# Altium project GTV4.0_Board.PrjPcb (part 7 of 11)

## Sheet Valve_Section.SchDoc
size 420 x 297 mm; DocumentNumber: 12; SheetNumber: 12; SheetTotal: 17
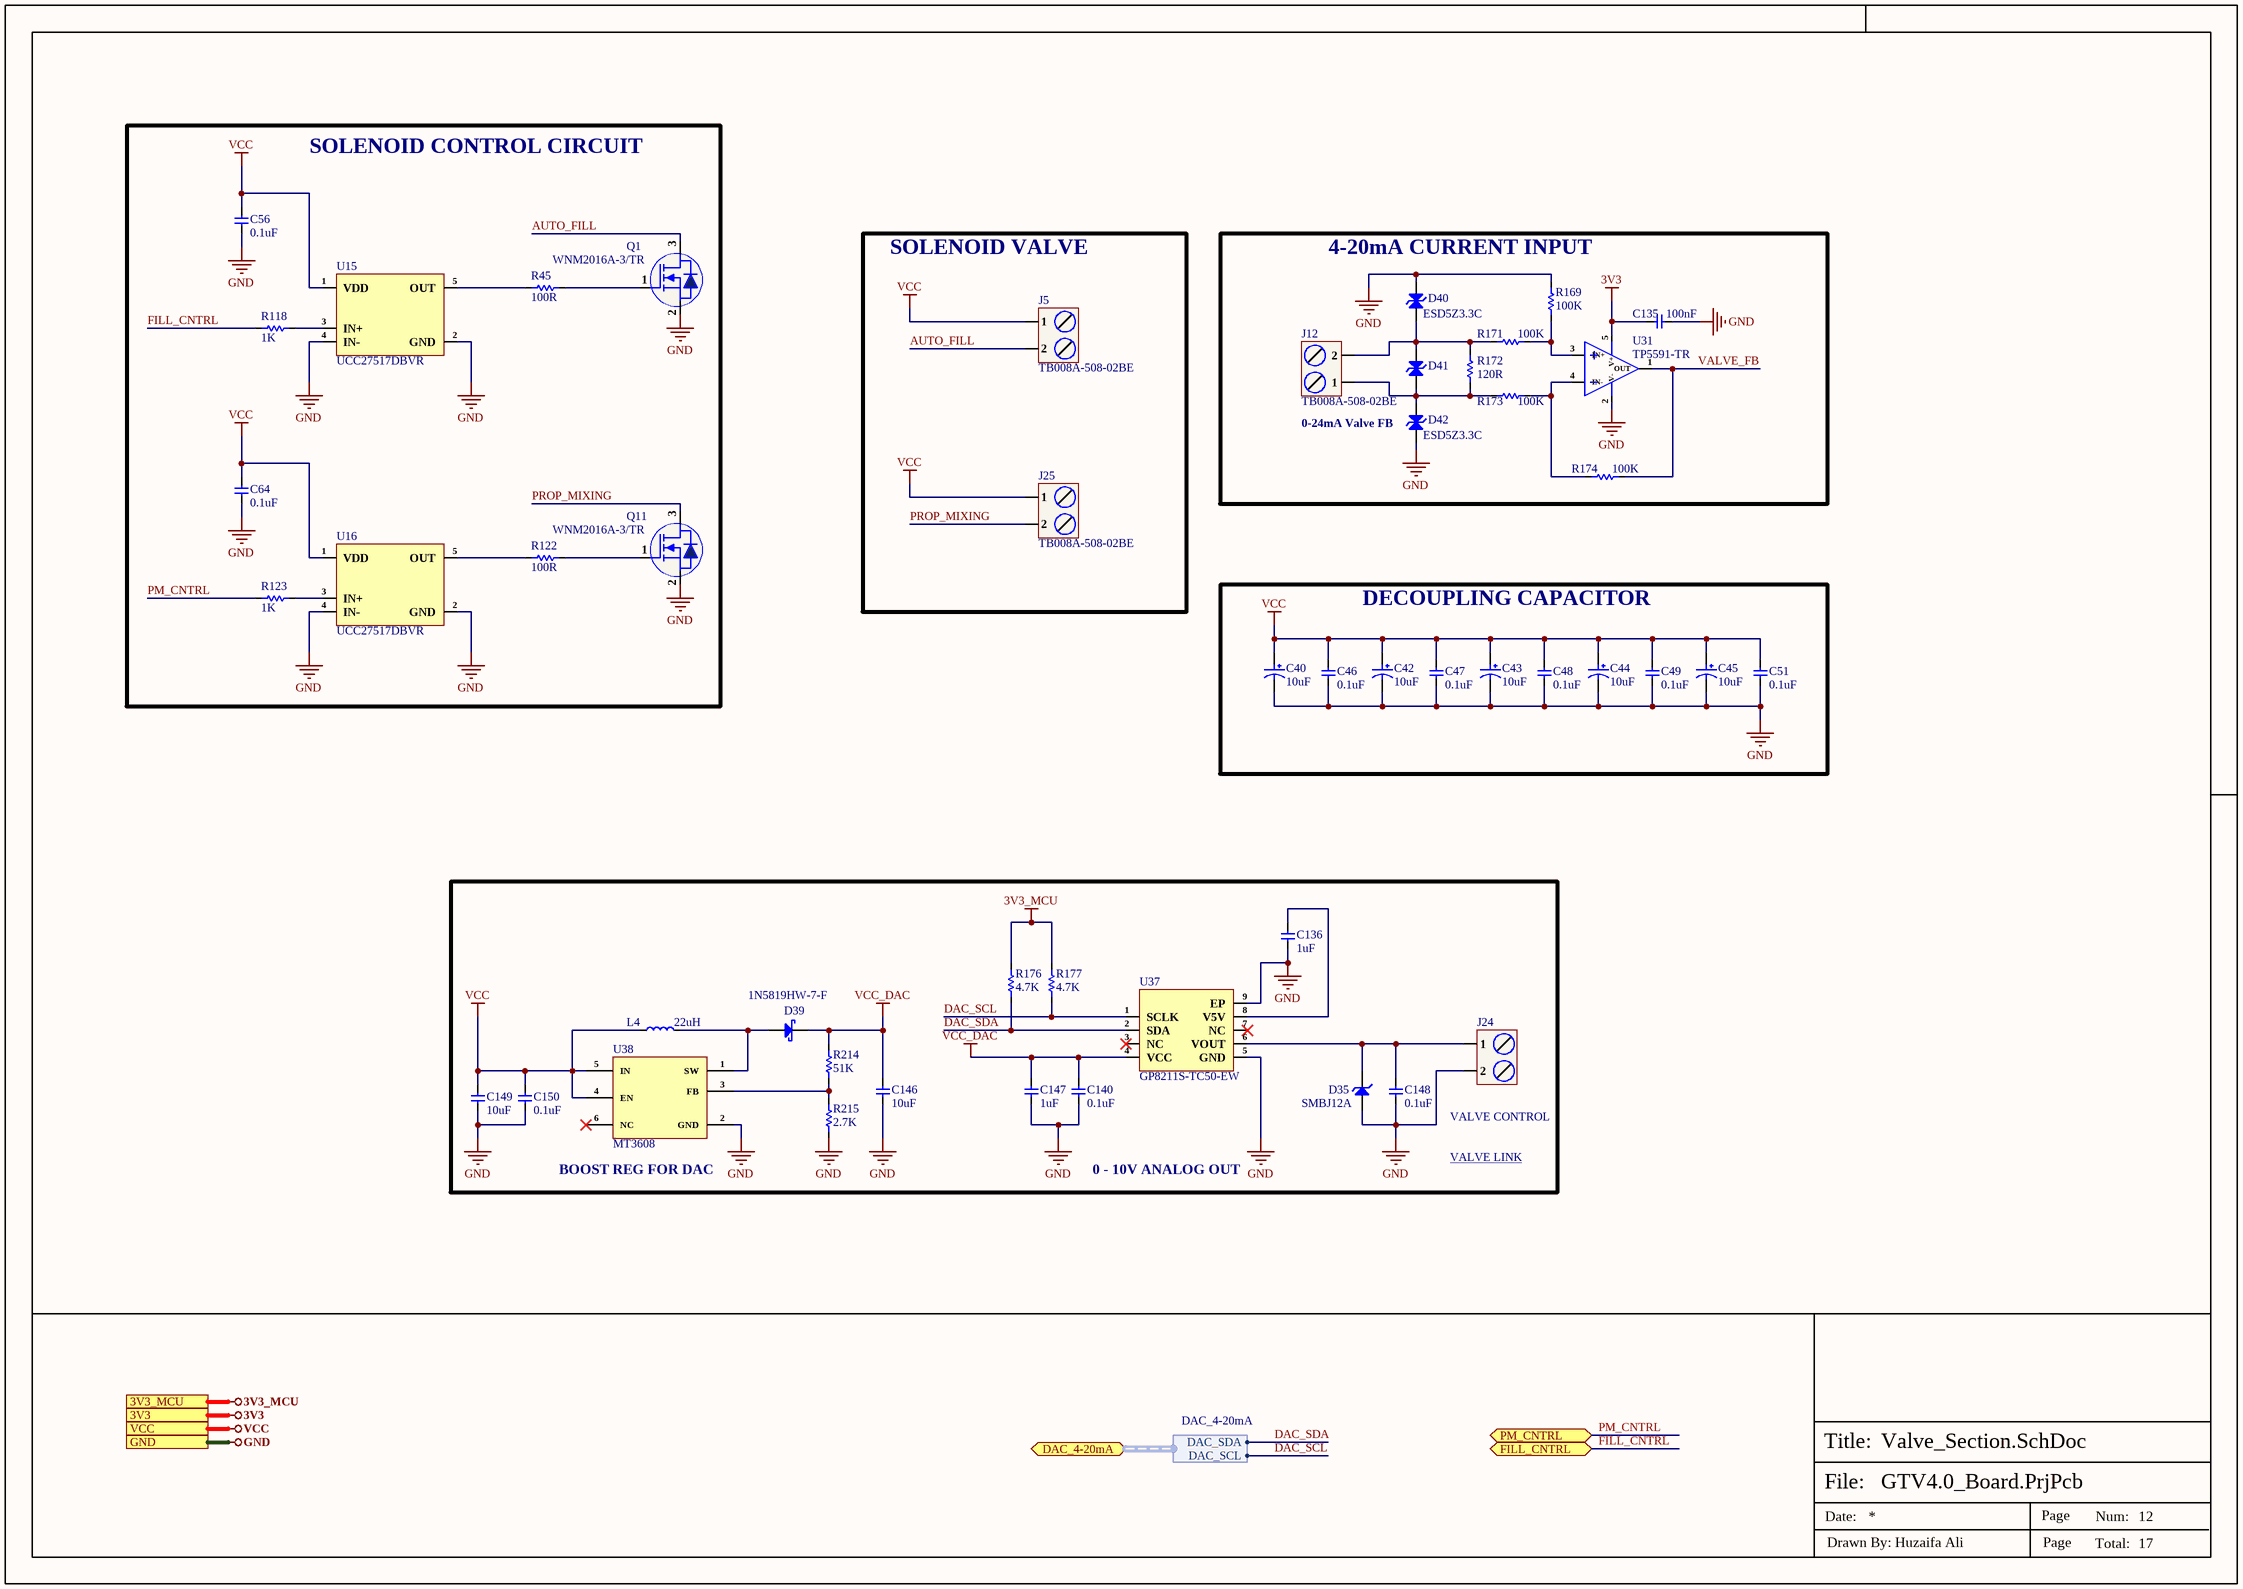
[diagram p12: Valve_Section.SchDoc]

### Parts
C40  10uF  [RVT1E100M0405_]
C42  10uF  [RVT1E100M0405_]
C43  10uF  [RVT1E100M0405_]
C44  10uF  [RVT1E100M0405_]
C45  10uF  [RVT1E100M0405_]
C46  0.1uF  [Cap-0603]
C47  0.1uF  [Cap-0603]
C48  0.1uF  [Cap-0603]
C49  0.1uF  [Cap-0603]
C51  0.1uF  [Cap-0603]
C56  0.1uF  [Cap-0402]
C64  0.1uF  [Cap-0402]
C135  100nF  [Cap-0603]
C136  1uF  [Cap-0402]
C140  0.1uF  [Cap-0402]
C146  10uF  [Cap-0805]
C147  1uF  [Cap-0402]
C148  0.1uF  [Cap-0402]
C149  10uF  [Cap-0805]
C150  0.1uF  [Cap-0402]
D35  SMBJ12A  [SMB_]
D39  1N5819HW-7-F  [SOD-123]
D40  ESD5Z3.3C  [SOD-523 (Bi-Directional)]
D41  ESD5Z3.3C  [SOD-523 (Bi-Directional)]  (value not drawn)
D42  ESD5Z3.3C  [SOD-523 (Bi-Directional)]
J5  TB008A-508-02BE  [TB008A-508-02BE]
J12  TB008A-508-02BE  [TB008A-508-02BE]
J24  TB008A-508-02BE  [TB008A-508-02BE]  (value not drawn)
J25  TB008A-508-02BE  [TB008A-508-02BE]
L4  22uH  [YNR4018-220M]
Q1  WNM2016A-3/TR  [sot-23]
Q11  WNM2016A-3/TR  [sot-23]
R45  100R  [RES-0603]
R118  1K  [Res-0402]
R122  100R  [RES-0603]
R123  1K  [Res-0402]
R169  100K  [Res-0603]
R171  100K  [Res-0603]
R172  120R  [Res-0603]
R173  100K  [Res-0603]
R174  100K  [Res-0603]
R176  4.7K  [Res-0402]
R177  4.7K  [Res-0402]
R214  51K  [Res-0402]
R215  2.7K  [Res-0402]
U15  UCC27517DBVR  [SOT-23-5]
U16  UCC27517DBVR  [SOT-23-5]
U31  TP5591-TR  [SOT-23-5]
U37  GP8211S-TC50-EW  [ESOP-8]
U38  MT3608  [SOT-23-6]

### Blocks framed on the sheet
SOLENOID CONTROL CIRCUIT: C56 C64 Q1 Q11 R45 R118 R122 R123 U15 U16
SOLENOID VALVE: J5 J25
4-20mA CURRENT INPUT: C135 D40-D42 J12 R169 R171-R174 U31
DECOUPLING CAPACITOR: C40 C42-C49 C51

### Ports
3V3, 3V3_MCU, DAC_4-20mA (bidir, harness DAC_4-20mA), FILL_CNTRL (bidir), GND, PM_CNTRL (bidir), VCC

### Harnesses
DAC_4-20mA: DAC_SDA, DAC_SCL

### Nets
3V3: C135.2 U31.5(V+) ; port 3V3
3V3_MCU: R176.2 R177.2 ; port 3V3_MCU
GND: C40.2 C42.2 C43.2 C44.2 C45.2 C46.1 C47.1 C48.1 C49.1 C51.1 C56.1 C64.1 C135.1 C136.1 C140.1 C146.1 C147.1 C148.1 C149.1 C150.1 D35.1(A) D40.2(A) D42.1(A) J24.2 Q1.2(S) Q11.2(S) R169.2 R215.1 U15.2(GND) U15.4(IN-) U16.2(GND) U16.4(IN-) U31.2(V-) U37.5(GND) U37.9(EP) U38.2(GND) ; port GND
VCC: C40.1 C42.1 C43.1 C44.1 C45.1 C46.2 C47.2 C48.2 C49.2 C51.2 C56.2 C64.2 C149.2 C150.2 J5.1 J25.1 L4.1 U15.1(VDD) U16.1(VDD) U38.4(EN) U38.5(IN) ; port VCC
VCC_DAC: C140.2 C146.2 C147.2 D39.2(K) R214.2 U37.4(VCC)
AUTO_FILL: J5.2 Q1.3(D)
DAC_SCL: R177.1 U37.1(SCLK) ; port DAC_4-20mA.DAC_SCL
DAC_SDA: R176.1 U37.2(SDA) ; port DAC_4-20mA.DAC_SDA
FILL_CNTRL: R118.1 ; port FILL_CNTRL
PM_CNTRL: R123.1 ; port PM_CNTRL
PROP_MIXING: J25.2 Q11.3(D)
VALVE_FB: R174.2 U31.1(OUT)
NetC136_2: C136.2 U37.8(V5V)
NetC148_2: C148.2 D35.2(K) J24.1 U37.6(VOUT)
NetD39_1: D39.1(A) L4.2 U38.1(SW)
NetD40_1: D40.1(A) D41.2(A) J12.2 R171.1 R172.2
NetD41_1: D41.1(A) D42.2(A) J12.1 R172.1 R173.1
NetQ1_1: Q1.1(G) R45.2
NetQ11_1: Q11.1(G) R122.2
NetR45_1: R45.1 U15.5(OUT)
NetR118_2: R118.2 U15.3(IN+)
NetR122_1: R122.1 U16.5(OUT)
NetR123_2: R123.2 U16.3(IN+)
NetR169_1: R169.1 R171.2 U31.3(IN+)
NetR173_2: R173.2 R174.1 U31.4(IN-)
NetR214_1: R214.1 R215.2 U38.3(FB)

Not connected (* = marked no-connect by the designer): U37 3(NC)* 7(NC)*; U38 6(NC)*

### Notes on the sheet
- 0-24mA Valve FB
- VALVE CONTROL
- (near U38) BOOST REG FOR DAC
- 0 - 10V ANALOG OUT
- VALVE LINK <https://vi.aliexpress.com/i/2251832634251781.html?gatewayAdapt=glo2vnm4itemAdapt>
- File:
- Title:
- Date:
- Page
- Num:
- Total:
- Drawn By: Huzaifa Ali

### Library data of the parts
C40 C42-C45 = RVT1E100M0405: as C76 on sheet WIFI_Display_Sheet; Operating Temperature: -45℃~+105℃; Rated Voltage: 25V; Capacitance: 10uF; Manufacturer Part Number: RVT1E100M0405; ComponentLink1Description: LCSC; ComponentLink1URL: https://www.lcsc.com/product-detail/Aluminum-Electrolytic-Capacitors-SMD_10uF-25V-20_C72484.html; LCSC Part Number: C970655
C46-C49 C51 = CC0603ZRY5V9BB104: as C69 on sheet WIFI_Display_Sheet; Supplier 1: Digi-Key; Manufacturer Part Number: CC0603ZRY5V9BB104; Stock 1: 15000880; Pricing 1: 1=0.1, 10=0.075, 100=0.0334, 500=0.02386, 1000=0.01874 (USD); Mount: Surface Mount; Case/Package: 0603; Number of Pins: 2; Case Code (Metric): 1608; Case Code (Imperial): 0603; Min Operating Temperature: -30°C; Max Operating Temperature: 85°C; Dielectric: Y5V; Voltage Rating: 50V; Package Quantity: 1; Packaging: Tape and Reel; Voltage Rating (DC): 50V; Termination: SMD/SMT; Composition: Ceramic; Voltage: 50V; Length: 1.6mm; Height: 0.8mm; Width: 0.031inch; Thickness: 0.035inch; Depth: 0.8mm; Radiation Hardening: No; REACH SVHC: No SVHC; Lead Free: Lead Free; Halogen Free: Halogen Free; ComponentLink1URL: http://www.yageo.com/documents/recent/UPY-GPHC_Y5V_6.3V-to-50V_8.pdf?src-supplier=Digi-Key; ComponentLink1Description: http://www.yageo.com/documents/recent/UPY-GPHC_Y5V_6.3V-to-50V_8.pdf?src-supplier=Digi-Key; ComponentLink2URL: http://www.yageo.com/documents/recent/UPY-GPHC_Y5V_6.3V-to-50V_5.pdf?src-supplier=Avnet+Europe; ComponentLink2Description: http://www.yageo.com/documents/recent/UPY-GPHC_Y5V_6.3V-to-50V_5.pdf?src-supplier=Avnet+Europe; ComponentLink3URL: https://www.verical.com/server-webapp/html/getDatasheet?partID=403611&src-supplier=Verical; ComponentLink3Description: https://www.verical.com/server-webapp/html/getDatasheet?partID=403611&src-supplier=Verical; ComponentLink4URL: http://www.mouser.com/ds/2/447/Yageo_UPY-GP_NP0_16V-to-50V_9-358835.pdf?src-supplier=Mouser; ComponentLink4Description: http://www.mouser.com/ds/2/447/Yageo_UPY-GP_NP0_16V-to-50V_9-358835.pdf?src-supplier=Mouser; ComponentLink5URL: http://www.farnell.com/datasheets/1132289.pdf?src-supplier=Element14; ComponentLink5Description: http://www.farnell.com/datasheets/1132289.pdf?src-supplier=Element14; Supplier Part Number 1: 311-1343-1-ND; LCSC Part Number: C106221
C56 C64 = CC0402JRX7R7BB104: CAP CER 0.1UF 16V X7R 0402; Manufacturer: Yageo; Material: 4241ConductorMaterial; Value: 100nF; Tolerance: 5%; Item Type: Capacitor; Supplier: Digikey; Supplier Part Number: 311-1676-1-ND; Manufacturer Part Number: CC0402JRX7R7BB104; RoHS: Yes; Category: Ceramic Capacitors; Stock: 1659111; Pricing: 1=0.1, 10=0.046, 50=0.0262, 100=0.0203, 500=0.01528, 1000=0.012, 2500=0.01091, 5000=0.01004 (USD); Mounting Technology: Surface Mount; Case/Package: 0402; Case Code (Metric): 1005; Case Code (Imperial): 0402; Min Operating Temperature: -55°C; Max Operating Temperature: 125°C; Dielectric: X7R; Packaging: Tape and Reel; Package Quantity: 10000; Voltage Rating (DC): 16V; Voltage Rating: 16V; Series: CC; Construction: Flat; Length: 0.039inch; Width: 0.02inch; Height: 0.5mm; Thickness: 0.022inch; Lead Free: Lead Free; Halogen Free: Halogen Free; RoHS Compliant: Yes; ComponentLink1URL: https://datasheet.ciiva.com/13210/upy-gphc-x7r-6-3v-to-50v-8-12304-13210152.pdf?src-supplier=Mouser; ComponentLink1Description: https://datasheet.ciiva.com/13210/upy-gphc-x7r-6-3v-to-50v-8-12304-13210152.pdf?src-supplier=Mouser; LCSC Part Number: C541464
C135 = CC0603KRX5R9BB104: CAP CER 0.1UF 50V X5R 0603; Manufacturer: Yageo; Tolerance: 10%; Item Type: Capacitor; Supplier 1: Digi-Key; Manufacturer Part Number: CC0603KRX5R9BB104; RoHS: Yes; Category: Ceramic Capacitors; Stock 1: 152253; Pricing 1: 1=0.10000, 10=0.05200, 50=0.02820, 100=0.02310, 500=0.01648, 1000=0.01294 (USD); Mount: Surface Mount; Case/Package: 0603; Case Code (Imperial): 0603; Case Code (Metric): 1608; Weight: 7.1E-05oz; Min Operating Temperature: -55°C; Max Operating Temperature: 85°C; Capacitance: 100nF; Packaging: Tape and Reel; Voltage Rating: 50V; Dielectric: X5R; Termination: SMD/SMT; Voltage Rating (DC): 50V; Package Quantity: 4000; Length: 0.063inch; Width: 0.031inch; Thickness: 0.035inch; Lead Free: Lead Free; Halogen Free: Halogen Free; ComponentLink1URL: http://www.mouser.com/ds/2/447/Yageo_UPY-GP_NP0_16V-to-50V_9-358835.pdf?src-supplier=Mouser; ComponentLink1Description: http://www.mouser.com/ds/2/447/Yageo_UPY-GP_NP0_16V-to-50V_9-358835.pdf?src-supplier=Mouser; ComponentLink2URL: https://www.yageo.com/upload/media/product/productsearch/datasheet/mlcc/UPY-GPHC_X5R_4V-to-50V_26.pdf?src-supplier=Digi-Key; ComponentLink2Description: https://www.yageo.com/upload/media/product/productsearch/datasheet/mlcc/UPY-GPHC_X5R_4V-to-50V_26.pdf?src-supplier=Digi-Key; ComponentLink3URL: http://www.yageo.com/exep/pages/download/literatures/ProductSelectionGuide%202014_Final_2.pdf?src-supplier=Digi-Key; ComponentLink3Description: http://www.yageo.com/exep/pages/download/literatures/ProductSelectionGuide%202014_Final_2.pdf?src-supplier=Digi-Key; Supplier Part Number 1: 311-4046-1-ND; LCSC Part Number: C110022
C136 = CC0402KRX5R7BB105: as C7 on sheet Controller_Section; Supplier 1: Digi-Key; Manufacturer Part Number: CC0402KRX5R7BB105; Stock 1: 1405667; Pricing 1: 1=0.36, 10=0.252, 100=0.1512, 500=0.1134, 1000=0.09576, 2500=0.09072, 5000=0.08568 (USD); Mount: Surface Mount; Case/Package: 0402; Weight: 2.3E-05oz; Case Code (Imperial): 0402; Case Code (Metric): 1005; Min Operating Temperature: -55°C; Max Operating Temperature: 85°C; Capacitance: 1uF; Dielectric: X5R; Packaging: Tape and Reel; Voltage Rating (DC): 16V; Voltage Rating: 16V; Termination: SMD/SMT; Composition: Ceramic; Length: 1mm; Height: 0.5mm; Width: 0.02inch; Thickness: 0.022inch; Depth: 0.5mm; Radiation Hardening: No; Lead Free: Lead Free; Halogen Free: Halogen Free; ComponentLink1URL: http://www.yageo.com/documents/recent/UPY-GPHC_X5R_4V-to-50V_12.pdf?src-supplier=Avnet+Europe; ComponentLink1Description: http://www.yageo.com/documents/recent/UPY-GPHC_X5R_4V-to-50V_12.pdf?src-supplier=Avnet+Europe; Supplier Part Number 1: 311-1691-6-ND; LCSC Part Number: C325464
C140 C148 C150 = CC0402KRX7R8BB104: CAP CER 0.1UF 25V X7R 0402; Manufacturer: Yageo; Tolerance: 10%; Capacitance: 100nF; Dissipation Factor: 3.5%; Supplier 1: Digi-Key; Manufacturer Part Number: CC0402KRX7R8BB104; RoHS: Yes; Category: Ceramic Capacitors; Stock 1: 1841009; Pricing 1: 1=0.10000, 10=0.03100, 50=0.01700, 100=0.01390, 500=0.00990, 1000=0.00777, 2500=0.00707, 5000=0.00650 (USD); Mount: Surface Mount; Case/Package: 0402; Case Code (Imperial): 0402; Case Code (Metric): 1005; Min Operating Temperature: -55°C; Max Operating Temperature: 125°C; Dielectric: X7R; Voltage Rating: 25V; Voltage Rating (DC): 25V; Packaging: Tape and Reel; Termination: SMD/SMT; Resistor Type: Ceramic; Length: 1mm; Width: 0.02inch; Height: 0.5mm; Thickness: 0.022inch; Depth: 0.5mm; Radiation Hardening: No; Lead Free: Lead Free; Halogen Free: Halogen Free; ComponentLink1URL: https://datasheet.ciiva.com/11464/upy-gphc-x7r-6-3v-to-50v-8-11464889.pdf?src-supplier=Avnet; ComponentLink1Description: https://datasheet.ciiva.com/11464/upy-gphc-x7r-6-3v-to-50v-8-11464889.pdf?src-supplier=Avnet; ComponentLink2URL: https://datasheet.ciiva.com/13210/upy-gphc-x7r-6-3v-to-50v-8-12304-13210908.pdf?src-supplier=Mouser; ComponentLink2Description: https://datasheet.ciiva.com/13210/upy-gphc-x7r-6-3v-to-50v-8-12304-13210908.pdf?src-supplier=Mouser; ComponentLink3URL: https://datasheet.ciiva.com/17437/upy-gphc-x7r-6-3v-to-50v-8-17437357.pdf?src-supplier=Avnet+Europe; ComponentLink3Description: https://datasheet.ciiva.com/17437/upy-gphc-x7r-6-3v-to-50v-8-17437357.pdf?src-supplier=Avnet+Europe; Supplier Part Number 1: 311-2077-1-ND; LCSC Part Number: C105883
C146 = EMK212BB7106MG-T: CAP CER 10UF 16V X7R 0805; Manufacturer: Taiyo Yuden; Tolerance: 20%; Item Type: Capacitor; Supplier 1: Digi-Key; Manufacturer Part Number: EMK212BB7106MG-T; RoHS: Yes; Category: Ceramic Capacitors; Stock 1: 896107; Pricing 1: 1=0.40000, 10=0.28000, 50=0.19620, 100=0.16820, 500=0.12612, 1000=0.10650 (USD); Mount: Surface Mount; Case/Package: 0805; Case Code (Metric): 2012; Case Code (Imperial): 0805; Min Operating Temperature: -55°C; Max Operating Temperature: 125°C; Package Quantity: 3000; Packaging: Tape and Reel; Capacitance: 10uF; Voltage Rating: 16V; Voltage Rating (DC): 16V; Dielectric: X7R; Termination: SMD/SMT; Resistor Type: Ceramic; Length: 2mm; Width: 0.049inch; Height: 1.25mm; Thickness: 0.053inch; Ratings: AEC-Q200; Halogen Free: Halogen Free; RoHS Compliant: Yes; ComponentLink1URL: https://datasheet.ciiva.com/24393/472emk212bb7106mg-t-24393497.pdf?src-supplier=Onlinecomponents.com; ComponentLink1Description: https://datasheet.ciiva.com/24393/472emk212bb7106mg-t-24393497.pdf?src-supplier=Onlinecomponents.com; ComponentLink2URL: https://datasheet.ciiva.com/30229/379emk212bb7106mg-t-30229719.pdf?src-supplier=Onlinecomponents.com; ComponentLink2Description: https://datasheet.ciiva.com/30229/379emk212bb7106mg-t-30229719.pdf?src-supplier=Onlinecomponents.com; ComponentLink3URL: https://datasheet.ciiva.com/18697/mlcc-all-e-18697736.pdf?src-supplier=Digi-Key; ComponentLink3Description: https://datasheet.ciiva.com/18697/mlcc-all-e-18697736.pdf?src-supplier=Digi-Key; ComponentLink4URL: https://datasheet.ciiva.com/18697/mlcc-all-e-18697735.pdf?src-supplier=Digi-Key; ComponentLink4Description: https://datasheet.ciiva.com/18697/mlcc-all-e-18697735.pdf?src-supplier=Digi-Key; ComponentLink5URL: https://datasheet.ciiva.com/18697/mlcc-all-e-18697737.pdf?src-supplier=Digi-Key; ComponentLink5Description: https://datasheet.ciiva.com/18697/mlcc-all-e-18697737.pdf?src-supplier=Digi-Key; ComponentLink6URL: https://datasheet.ciiva.com/15376/mlcc01-e-15376088.pdf?src-supplier=Mouser; ComponentLink6Description: https://datasheet.ciiva.com/15376/mlcc01-e-15376088.pdf?src-supplier=Mouser; Supplier Part Number 1: 587-3319-1-ND; LCSC Part Number: C141287
C147 = CC0402KRX5R8BB105: CAP CER 1UF 25V X5R 0402; Manufacturer: Yageo; Tolerance: 10%; Supplier 1: Mouser; Manufacturer Part Number: CC0402KRX5R8BB105; RoHS: Yes; Category: Ceramic Capacitors; Stock 1: 91975; Pricing 1: 1=0.30000, 10=0.20400, 50=0.20400, 100=0.11600, 1000=0.07200, 10000=0.05900 (USD); Mount: Surface Mount; Case/Package: 0402; Case Code (Metric): 1005; Case Code (Imperial): 0402; Weight: 2.3E-05oz; Min Operating Temperature: -55°C; Max Operating Temperature: 85°C; Packaging: Tape and Reel; Capacitance: 1uF; Voltage Rating: 25V; Dielectric: X5R; Termination: SMD/SMT; Voltage Rating (DC): 25V; Package Quantity: 10000; Length: 0.039inch; Width: 0.02inch; Thickness: 0.022inch; Lead Free: Lead Free; Halogen Free: Halogen Free; RoHS Compliant: Yes; ComponentLink1URL: http://www.mouser.com/ds/2/447/Yageo_UPY-GP_NP0_16V-to-50V_9-358835.pdf?src-supplier=Mouser; ComponentLink1Description: http://www.mouser.com/ds/2/447/Yageo_UPY-GP_NP0_16V-to-50V_9-358835.pdf?src-supplier=Mouser; ComponentLink2URL: http://www.yageo.com/documents/recent/UPY-GPHC_X5R_4V-to-50V_25.pdf?src-supplier=Digi-Key; ComponentLink2Description: http://www.yageo.com/documents/recent/UPY-GPHC_X5R_4V-to-50V_25.pdf?src-supplier=Digi-Key; ComponentLink3URL: https://4donline.ihs.com/images/VipMasterIC/IC/YAGO/YAGO-S-A0006851646/YAGO-S-A0006851646-1.pdf?hkey=6D3A4C79FDBF58556ACFDE234799DDF0&src-supplier=Newark; ComponentLink3Description: https://4donline.ihs.com/images/VipMasterIC/IC/YAGO/YAGO-S-A0006851646/YAGO-S-A0006851646-1.pdf?hkey=6D3A4C79FDBF58556ACFDE234799DDF0&src-supplier=Newark; Supplier Part Number 1: 603-CC402KRX5R8BB105; LCSC Part Number: C326568
C149 = CC0805KKX5R8BB106: CAP CER 10UF 25V X5R 0805; Manufacturer: Yageo; Tolerance: 10%; Item Type: Capacitor; Supplier 1: Digi-Key; Manufacturer Part Number: CC0805KKX5R8BB106; RoHS: Yes; Category: Ceramic Capacitors; Stock 1: 554290; Pricing 1: 1=0.31000, 10=0.21200, 50=0.14820, 100=0.12710, 500=0.09534, 1000=0.08050 (USD); Mount: Surface Mount; Case/Package: 0805; Case Code (Imperial): 0805; Case Code (Metric): 2012; Weight: 0.000194oz; Min Operating Temperature: -55°C; Max Operating Temperature: 85°C; Capacitance: 10uF; Voltage Rating (DC): 25V; Packaging: Tape and Reel; Voltage Rating: 25V; Dielectric: X5R; Termination: SMD/SMT; Resistor Type: Ceramic; Series: CC; Length: 0.079inch; Width: 0.049inch; Thickness: 0.057inch; Depth: 1.25mm; Lead Free: Lead Free; Halogen Free: Halogen Free; RoHS Compliant: Yes; ComponentLink1URL: http://www.mouser.com/ds/2/447/UPY-GPHC_X5R_4V-to-50V_25-1131599.pdf?src-supplier=Mouser; ComponentLink1Description: http://www.mouser.com/ds/2/447/UPY-GPHC_X5R_4V-to-50V_25-1131599.pdf?src-supplier=Mouser; ComponentLink2URL: http://www.yageo.com/documents/recent/UPY-GPHC_X5R_4V-to-50V_25.pdf?src-supplier=Digi-Key; ComponentLink2Description: http://www.yageo.com/documents/recent/UPY-GPHC_X5R_4V-to-50V_25.pdf?src-supplier=Digi-Key; Supplier Part Number 1: 311-1869-1-ND; LCSC Part Number: C89831
D35 = SMBJ12A: TVS DIODE 12VWM 19.9VC DO214AA; Manufacturer: Littelfuse; Item Type: TVS Diodes; Supplier: Digikey; LCSC Part Number: C151251; Manufacturer Part Number: SMBJ12A; RoHS: Yes; Stock: 39718; Pricing: 1=0.32, 10=0.215, 100=0.104 (USD); ComponentLink1URL: https://datasheet.ciiva.com/15143/getdatasheetpartid-185160-15143884.pdf?src-supplier=Verical; ComponentLink1Description: https://datasheet.ciiva.com/15143/getdatasheetpartid-185160-15143884.pdf?src-supplier=Verical; ComponentLink2URL: https://datasheet.ciiva.com/34302/1546611-34302457.pdf?src-supplier=Jameco; ComponentLink2Description: https://datasheet.ciiva.com/34302/1546611-34302457.pdf?src-supplier=Jameco; ComponentLink3URL: https://datasheet.ciiva.com/25624/0900766b810f4eeb-25624681.pdf?src-supplier=Rs; ComponentLink3Description: https://datasheet.ciiva.com/25624/0900766b810f4eeb-25624681.pdf?src-supplier=Rs; ComponentLink4URL: https://datasheet.ciiva.com/16287/littelfuse-tvs-diode-smbj-16287565.pdf?src-supplier=Future+Electronics; ComponentLink4Description: https://datasheet.ciiva.com/16287/littelfuse-tvs-diode-smbj-16287565.pdf?src-supplier=Future+Electronics; ComponentLink5URL: https://datasheet.ciiva.com/331/littelfuse-tvs-diode-smbj-datasheet-pdf-331137.pdf?src-supplier=Digikey; ComponentLink5Description: https://datasheet.ciiva.com/331/littelfuse-tvs-diode-smbj-datasheet-pdf-331137.pdf?src-supplier=Digikey; ComponentLink6URL: https://datasheet.ciiva.com/331/littelfuse-tvs-diode-smbj-datasheet-pdf-331138.pdf?src-supplier=Digikey; ComponentLink6Description: https://datasheet.ciiva.com/331/littelfuse-tvs-diode-smbj-datasheet-pdf-331138.pdf?src-supplier=Digikey; ComponentLink7URL: https://datasheet.ciiva.com/331/littelfuse-tvs-diode-smbj-datasheet-pdf-331139.pdf?src-supplier=Digikey; ComponentLink7Description: https://datasheet.ciiva.com/331/littelfuse-tvs-diode-smbj-datasheet-pdf-331139.pdf?src-supplier=Digikey; ComponentLink8URL: https://datasheet.ciiva.com/8062/littelfuse-tvs-diode-smbj-8062301.pdf?src-supplier=Element14; ComponentLink8Description: https://datasheet.ciiva.com/8062/littelfuse-tvs-diode-smbj-8062301.pdf?src-supplier=Element14
D39 = 1N5819HW-7-F: DIODE SCHOTTKY 40V 1A SOD123; Manufacturer: Diodes; Forward Voltage: 450mV; Max Reverse Current: 50uA; Element Configuration: Single; Max Forward Surge Current (Ifsm): 25A; Max Power Dissipation: 450mW; Polarity: Standard; Capacitance: 110pF; Supplier 1: Digi-Key; Manufacturer Part Number: 1N5819HW-7-F; RoHS: Yes; Category: Schottky Diodes; Pricing 1: 1=0.46000, 10=0.34500, 100=0.19530, 500=0.12936, 1000=0.09918 (USD); Case/Package: SOD-123-2; Number of Pins: 2; Weight: 0.000353oz; Contact Plating: Tin,Matte; Min Operating Temperature: -65°C; Max Operating Temperature: 125°C; Forward Current: 1A; Max Repetitive Reverse Voltage (Vrrm): 40V; Packaging: Tape and Reel; Peak Non-Repetitive Surge Current: 25A; Package Quantity: 3000; Average Rectified Current: 1A; Termination: SMD/SMT; Voltage Rating (DC): 40V; Current Rating: 1A; Output Current: 1A; Max Reverse Voltage (DC): 40V; Series: -; Length: 2.85mm; Width: 1.7mm; Height: 1.25mm; Radiation Hardening: No; RoHS Compliant: Yes; REACH SVHC: No SVHC; Lead Free: Lead Free; ComponentLink1URL: https://datasheet.ciiva.com/16303/ds30217-16303296.pdf?src-supplier=Future+Electronics; ComponentLink1Description: https://datasheet.ciiva.com/16303/ds30217-16303296.pdf?src-supplier=Future+Electronics; ComponentLink2URL: https://datasheet.ciiva.com/27092/1538419-27092484.pdf?src-supplier=Jameco; ComponentLink2Description: https://datasheet.ciiva.com/27092/1538419-27092484.pdf?src-supplier=Jameco; ComponentLink3URL: https://datasheet.ciiva.com/912/ds30217-912801.pdf?src-supplier=Digi-Key; ComponentLink3Description: https://datasheet.ciiva.com/912/ds30217-912801.pdf?src-supplier=Digi-Key; ComponentLink4URL: https://datasheet.ciiva.com/1177/ds30217-1177089.pdf?src-supplier=Element14; ComponentLink4Description: https://datasheet.ciiva.com/1177/ds30217-1177089.pdf?src-supplier=Element14; ComponentLink5URL: https://datasheet.ciiva.com/912/ds30217-912802.pdf?src-supplier=Digi-Key; ComponentLink5Description: https://datasheet.ciiva.com/912/ds30217-912802.pdf?src-supplier=Digi-Key; ComponentLink6URL: https://datasheet.ciiva.com/912/ds30217-912803.pdf?src-supplier=Digi-Key; ComponentLink6Description: https://datasheet.ciiva.com/912/ds30217-912803.pdf?src-supplier=Digi-Key; ComponentLink7URL: https://datasheet.ciiva.com/8303/ds30217-8303132.pdf?src-supplier=Avnet; ComponentLink7Description: https://datasheet.ciiva.com/8303/ds30217-8303132.pdf?src-supplier=Avnet; ComponentLink8URL: https://datasheet.ciiva.com/25919/ds30217-25919644.pdf?src-supplier=Avnet+Europe; ComponentLink8Description: https://datasheet.ciiva.com/25919/ds30217-25919644.pdf?src-supplier=Avnet+Europe; Supplier Part Number 1: 1N5819HW-FDICT-ND; LCSC Part Number: C82544; Item Type: Diode
D40-D42 = ESD5Z3.3C: 5A 60W 12V 3.6V 3.3V SOD-523 ESD and Surge Protection (TVS/ESD) ROHS; Manufacturer: MDD(Microdiode Semiconductor); Manufacturer Part Number: ESD5Z3.3C; Package: SOD-523; LCSC Part Number: C502551; Item Type: (TVS/ESD); ComponentLink1Description: LCSC; ComponentLink1URL: https://www.lcsc.com/product-detail/ESD-and-Surge-Protection-TVS-ESD_MDD-Microdiode-Semiconductor-ESD5Z3-3C_C502551.html
J5 J12 J24 J25 = TB008A-508-02BE: TERMINAL BLOCK, SCREW TYPE, 5.08; Manufacturer: Same Sky; Item Type: Terminal Blocks; Approvals: CE, IEC, UL, cUL; Current Rating: 16A; Number of Contacts: 2; Number of Levels: 1; Pitch: 5.08mm; Voltage Rating: 300V; Wire/Cable Gauge: 12AWG; Supplier: DigiKey; Supplier Part Number: 102-6213-ND; Manufacturer Part Number: TB008A-508-02BE; RoHS: Compliant; Stock: 2734; Pricing: 1=0.61, 10=0.451, 25=0.3932, 50=0.3542, 100=0.3198, 250=0.282, 500=0.25896, 1200=0.23595, 6000=0.20759 (USD); Color: Blue; Height: 15.82mm; Lifecycle Status: Production; Max Operating Temperature: 105°C; Min Operating Temperature: -40°C; Mounting Technology: Screw; Number of Rows: 1; Width: 13.89mm; ComponentLink1URL: https://datasheet.octopart.com:443/TB008A-508-02BE-Same-Sky-datasheet-181920260.pdf?src-supplier=Same+Sky; ComponentLink1Description: https://datasheet.octopart.com:443/TB008A-508-02BE-Same-Sky-datasheet-181920260.pdf?src-supplier=Same+Sky; ComponentLink2URL: https://datasheet.octopart.com:443/TB008A-508-02BE-CUI-Devices-datasheet-175928141.pdf?src-supplier=Same+Sky; ComponentLink2Description: https://datasheet.octopart.com:443/TB008A-508-02BE-CUI-Devices-datasheet-175928141.pdf?src-supplier=Same+Sky; ComponentLink3URL: https://datasheet.octopart.com:443/TB008A-508-02BE-CUI-Devices-datasheet-144794964.pdf?src-supplier=Same+Sky; ComponentLink3Description: https://datasheet.octopart.com:443/TB008A-508-02BE-CUI-Devices-datasheet-144794964.pdf?src-supplier=Same+Sky; ComponentLink4URL: https://datasheet.octopart.com:443/TB008A-508-02BE-CUI-Devices-datasheet-180438533.pdf?src-supplier=IHS; ComponentLink4Description: https://datasheet.octopart.com:443/TB008A-508-02BE-CUI-Devices-datasheet-180438533.pdf?src-supplier=IHS; ComponentLink5URL: https://datasheet.octopart.com:443/TB008A-508-02BE-Same-Sky-datasheet-182881448.pdf?src-supplier=Electro+Sonic; ComponentLink5Description: https://datasheet.octopart.com:443/TB008A-508-02BE-Same-Sky-datasheet-182881448.pdf?src-supplier=Electro+Sonic; ComponentLink6URL: https://datasheet.octopart.com:443/TB008A-508-02BE-CUI-Devices-datasheet-154730749.pdf?src-supplier=Electro+Sonic; ComponentLink6Description: https://datasheet.octopart.com:443/TB008A-508-02BE-CUI-Devices-datasheet-154730749.pdf?src-supplier=Electro+Sonic; ComponentLink7URL: https://datasheet.octopart.com:443/TB008A-508-02BE-CUI-Devices-datasheet-175927974.pdf?src-supplier=CUI+Devices+SCT; ComponentLink7Description: https://datasheet.octopart.com:443/TB008A-508-02BE-CUI-Devices-datasheet-175927974.pdf?src-supplier=CUI+Devices+SCT; ComponentLink8URL: https://datasheet.octopart.com:443/TB008A-508-02BE-CUI-Devices-datasheet-142371924.pdf?src-supplier=Future+Electronics; ComponentLink8Description: https://datasheet.octopart.com:443/TB008A-508-02BE-CUI-Devices-datasheet-142371924.pdf?src-supplier=Future+Electronics; ComponentLink9URL: https://datasheet.octopart.com:443/TB008A-508-02BE-Same-Sky-datasheet-182050257.pdf?src-supplier=Future+Electronics; ComponentLink9Description: https://datasheet.octopart.com:443/TB008A-508-02BE-Same-Sky-datasheet-182050257.pdf?src-supplier=Future+Electronics; ComponentLink10URL: https://datasheet.octopart.com:443/TB008A-508-02BE-CUI-Devices-datasheet-175928506.pdf?src-supplier=Future+Electronics; ComponentLink10Description: https://datasheet.octopart.com:443/TB008A-508-02BE-CUI-Devices-datasheet-175928506.pdf?src-supplier=Future+Electronics; ComponentLink11URL: https://datasheet.octopart.com:443/TB008A-508-02BE-CUI-Devices-datasheet-147843969.pdf?src-supplier=Future+Electronics; ComponentLink11Description: https://datasheet.octopart.com:443/TB008A-508-02BE-CUI-Devices-datasheet-147843969.pdf?src-supplier=Future+Electronics; ComponentLink12URL: https://octopart.com:443/opatz8j6/c1?t=70RcvCe5ZkRgGfEt3V6vu9Rs4fRjMXZXdN7o_jKjc1dIStjs0IdWQTWbo2m4XJFZN-ZP8jrAm8ZplrmsDRNZWu5vD1uRxoUEzG546i7xsfV2Hlacn1XvUR2XbUoQGro5ohP2MwvVjf8PoqdhdL5ostV4A3wznZJYIF3cjV4w5lqdbJSsZe_bWwCbg-0xN0VRUvfB1EMY8Vje3Eupa8s9ZFT71pkE5p7-eHFbrk2At8AAZTx0zaGgq3cGzzCo7b3plQZDv0g9EsQyQUqhBC4JyFJJTeTHRWNNhUkmN73PD8OCyLOPLnegennELhgJeyY7HD7r-bGsAjSnjBwQDgR4SNS6WopDa7PwSknd4UaR&src-supplier=Compliance+Statements; ComponentLink12Description: https://octopart.com:443/opatz8j6/c1?t=70RcvCe5ZkRgGfEt3V6vu9Rs4fRjMXZXdN7o_jKjc1dIStjs0IdWQTWbo2m4XJFZN-ZP8jrAm8ZplrmsDRNZWu5vD1uRxoUEzG546i7xsfV2Hlacn1XvUR2XbUoQGro5ohP2MwvVjf8PoqdhdL5ostV4A3wznZJYIF3cjV4w5lqdbJSsZe_bWwCbg-0xN0VRUvfB1EMY8Vje3Eupa8s9ZFT71pkE5p7-eHFbrk2At8AAZTx0zaGgq3cGzzCo7b3plQZDv0g9EsQyQUqhBC4JyFJJTeTHRWNNhUkmN73PD8OCyLOPLnegennELhgJeyY7HD7r-bGsAjSnjBwQDgR4SNS6WopDa7PwSknd4UaR&src-supplier=Compliance+Statements; ComponentLink13URL: https://octopart.com:443/opatz8j6/c1?t=Uo7J4IF8yNdenAOC46u8Tj87WKOsK2A7c2vs8Sa5WYpsHicIfMoXbTSbdSiyOVgpxAIJCnEdsRMUssp9co8EivZcQamcZCig1rv7D-Ug8PwU11654nZt9VBHHEO9J9O1TmTLkeOA50viz6XbUTUcFOxEIWFtOIpsQudSLNpXl0qwCRhM7cqCRnP2WYjdfnel41QgPMBd0OmGtB5n4xaHO6yfR0O84tGT4DFJu17jeSMsdcHZCnKlQJPS09wnjUoIgC30PVYN35xN_xndXGhnfduxGQWssTNdQ2Ew4lLPFXECETpUa_FU3_NIDCJhBmvudBKdEuF4t1En-YL9AhFUeE1LU0Iszw0AVyDT8Hn1nDsKYQ&src-supplier=Compliance+Statements; ComponentLink13Description: https://octopart.com:443/opatz8j6/c1?t=Uo7J4IF8yNdenAOC46u8Tj87WKOsK2A7c2vs8Sa5WYpsHicIfMoXbTSbdSiyOVgpxAIJCnEdsRMUssp9co8EivZcQamcZCig1rv7D-Ug8PwU11654nZt9VBHHEO9J9O1TmTLkeOA50viz6XbUTUcFOxEIWFtOIpsQudSLNpXl0qwCRhM7cqCRnP2WYjdfnel41QgPMBd0OmGtB5n4xaHO6yfR0O84tGT4DFJu17jeSMsdcHZCnKlQJPS09wnjUoIgC30PVYN35xN_xndXGhnfduxGQWssTNdQ2Ew4lLPFXECETpUa_FU3_NIDCJhBmvudBKdEuF4t1En-YL9AhFUeE1LU0Iszw0AVyDT8Hn1nDsKYQ&src-supplier=Compliance+Statements; ComponentLink14URL: https://octopart.com:443/opatz8j6/c1?t=QvKslLqyPFzau17NptgVLNRcuMhYIDBdCODdkHqrYmlyYaojLdNAUnoimpM8kJVdayLtCnbbKOALirt3kAy58b19LXjk0_7F41XvMIDT0eRXxnt9UHZUhX802G-ZzTsQIZnaFSbz4MEhjhtI2qswXHCzfmb8sqF0HXUhYlN6-rqlzfA-OyFj0jZaaAfm4-lvU9uPpsocCV1oKDEwT57xEscWeOARtAbVwqthJApLrBmKsw-5DWDhVMlxDbVvBXDO0fpzQdRNXWzvV5iRUvpPqWvudAW3YO1yLdtS--LwTFp95_TZ35xs_jHFthiTFDMmHALKuZGPmqbJgedvZH3Zk3g47VKlaCUtWvKEaHE3&src-supplier=Compliance+Statements; ComponentLink14Description: https://octopart.com:443/opatz8j6/c1?t=QvKslLqyPFzau17NptgVLNRcuMhYIDBdCODdkHqrYmlyYaojLdNAUnoimpM8kJVdayLtCnbbKOALirt3kAy58b19LXjk0_7F41XvMIDT0eRXxnt9UHZUhX802G-ZzTsQIZnaFSbz4MEhjhtI2qswXHCzfmb8sqF0HXUhYlN6-rqlzfA-OyFj0jZaaAfm4-lvU9uPpsocCV1oKDEwT57xEscWeOARtAbVwqthJApLrBmKsw-5DWDhVMlxDbVvBXDO0fpzQdRNXWzvV5iRUvpPqWvudAW3YO1yLdtS--LwTFp95_TZ35xs_jHFthiTFDMmHALKuZGPmqbJgedvZH3Zk3g47VKlaCUtWvKEaHE3&src-supplier=Compliance+Statements; ComponentLink15URL: https://octopart.com:443/opatz8j6/c1?t=vaYY41CogfnopSfDOPxoaqGeCdGNbbMVVihVh9piZThYC4z5UdzLQjuTDbTJQBTosCtHjK1U8s3WuliWmK31H20qTGz1dkr0vY7KPWk-lwdRYh6T0AVJBxjWCi0eVjFp9VnnwA-vZFto2L6_FJ-1JJOZC7c21m4C6LgLcEGoiZY5ivV0bdaUH14NZNWQcfXhucKYp6KsuPDjo6IvsvVydEIyl4r3dmRXALVohKm2RtfKZd3dTcnpmcifjmEzWhR-u4uu0vOGtKFb8OyaUtZ3gXgC8hliX2ctByKhLk-vsmWP8rGswQgdKk_F7i01fLK7QHLl5nXUFhOop_anT0dafluEmPu9S4IjVmRqgao-gzkWkw&src-supplier=Compliance+Statements; ComponentLink15Description: https://octopart.com:443/opatz8j6/c1?t=vaYY41CogfnopSfDOPxoaqGeCdGNbbMVVihVh9piZThYC4z5UdzLQjuTDbTJQBTosCtHjK1U8s3WuliWmK31H20qTGz1dkr0vY7KPWk-lwdRYh6T0AVJBxjWCi0eVjFp9VnnwA-vZFto2L6_FJ-1JJOZC7c21m4C6LgLcEGoiZY5ivV0bdaUH14NZNWQcfXhucKYp6KsuPDjo6IvsvVydEIyl4r3dmRXALVohKm2RtfKZd3dTcnpmcifjmEzWhR-u4uu0vOGtKFb8OyaUtZ3gXgC8hliX2ctByKhLk-vsmWP8rGswQgdKk_F7i01fLK7QHLl5nXUFhOop_anT0dafluEmPu9S4IjVmRqgao-gzkWkw&src-supplier=Compliance+Statements
L4 = YNR4018-220M: 590mA 22uH ±20% SMD,4x4x1.8mm Power Inductors ROHS; Manufacturer: YJYCOIN; Manufacturer Part Number: YNR4018-220M; Package: SMD,4x4x1.8mm; LCSC Part Number: C340373; Item Type: Inductor; ComponentLink1Description: LCSC; ComponentLink1URL: https://www.lcsc.com/product-detail/Power-Inductors_YJYCOIN-YNR4018-220M_C340373.html
Q1 Q11 = WNM2016A-3/TR: Single N-Channel, 20V, 4.7A, Power MOSFET; Manufacturer: WILLSEMI; Manufacturer Part Number: WNM2016A-3/TR; Footprint: SOT-23-3; ComponentLink1Description: LCSC; ComponentLink1URL: https://www.lcsc.com/product-detail/MOSFETs_WILLSEMI-Will-Semicon-WNM2016A-3-TR_C601105.html; LCSC Part Number: C601105; Item Type: Mosfet
R45 R122 = RCA0603100RFKEAHP: RES SMD 100 OHM 1% 1/4W 0603; Manufacturer: Vishay Dale; Max Power Dissipation: 250mW; Temperature Coefficient: 100ppm/°C; Supplier 1: Digi-Key; Manufacturer Part Number: RCA0603100RFKEAHP; Stock 1: 0; Case/Package: 0603; Case Code (Imperial): 0603; Case Code (Metric): 1608; Min Operating Temperature: -55°C; Max Operating Temperature: 155°C; Resistor Type: Thick Film; Features: Automotive AEC-Q200,Anti-Sulfur; Packaging: Tape and Reel; Resistance: 100R; Tolerance: 1%; Number of Terminations: 2; RoHS Compliant: Yes; ComponentLink1URL: http://www.vishay.com/docs/20067/rcahp.pdf?src-supplier=Digi-Key; ComponentLink1Description: http://www.vishay.com/docs/20067/rcahp.pdf?src-supplier=Digi-Key; Supplier Part Number 1: 541-3244-2-ND; LCSC Part Number: C2074203
R118 R123 = RC0402FR-071KL: RES 1K OHM 1% 1/16W 0402; Manufacturer: Yageo; Resistance: 1kR; Temperature Coefficient: 100ppm/°C; Voltage Rating (DC): 50V; Power Rating: 62.5mW; Max Power Dissipation: 63mW; Item Type: Resistor; Supplier 1: Avnet; Manufacturer Part Number: RC0402FR-071KL; RoHS: Yes; Category: Chip SMD Resistors; Stock 1: 13030000; Pricing 1: 10000=0.00085, 20000=0.00087, 40000=0.00084, 60000=0.00083, 80000=0.00079, 100000=0.00078, 1000000=0.00076 (USD); Case/Package: 0402; Number of Pins: 2; Case Code (Imperial): 0402; Case Code (Metric): 1005; Size Code: 0402; Min Operating Temperature: -55°C; Max Operating Temperature: 155°C; Resistor Type: Thick Film; Tolerance: 1%; Packaging: Tape and Reel; Voltage Rating: 50V; Termination: SMD/SMT; Features: Moisture Resistant; Series: RC; Number of Terminations: 2; Resistance Tolerance: 1%; Construction: Rectangular; Technology: THICK FILM; Length: 1mm; Width: 0.5mm; Height: 0.32mm; Depth: 0.5mm; Reach SVHC Compliant: Yes; Lead Free: Lead Free; RoHS Compliant: Yes; Military Standard: Not; ComponentLink1URL: https://datasheet.ciiva.com/11819/0900766b80c66297-11819477.pdf?src-supplier=RSComponents; ComponentLink1Description: https://datasheet.ciiva.com/11819/0900766b80c66297-11819477.pdf?src-supplier=RSComponents; ComponentLink2URL: https://datasheet.ciiva.com/7983/1018594-7983502.pdf?src-supplier=Element14; ComponentLink2Description: https://datasheet.ciiva.com/7983/1018594-7983502.pdf?src-supplier=Element14; ComponentLink3URL: https://datasheet.ciiva.com/22747/1018594-22747513.pdf?src-supplier=Element14; ComponentLink3Description: https://datasheet.ciiva.com/22747/1018594-22747513.pdf?src-supplier=Element14; ComponentLink4URL: https://datasheet.ciiva.com/12666/pyu-rc0402-51-rohs-l-6-r-12666741.pdf?src-supplier=Mouser; ComponentLink4Description: https://datasheet.ciiva.com/12666/pyu-rc0402-51-rohs-l-6-r-12666741.pdf?src-supplier=Mouser; ComponentLink5URL: https://datasheet.ciiva.com/7849/1018594-7849869.pdf?src-supplier=Element14; ComponentLink5Description: https://datasheet.ciiva.com/7849/1018594-7849869.pdf?src-supplier=Element14; ComponentLink6URL: https://datasheet.ciiva.com/7849/1018594-7849871.pdf?src-supplier=Element14; ComponentLink6Description: https://datasheet.ciiva.com/7849/1018594-7849871.pdf?src-supplier=Element14; ComponentLink7URL: https://datasheet.ciiva.com/17063/pyu-rc0402-51-rohs-l-6-r-17063193.pdf?src-supplier=Future+Electronics; ComponentLink7Description: https://datasheet.ciiva.com/17063/pyu-rc0402-51-rohs-l-6-r-17063193.pdf?src-supplier=Future+Electronics; Supplier Part Number 1: RC0402FR-071KL; LCSC Part Number: C106235
R169 R171 R173 R174 = RT0603BRD07100KL: RES SMD 100K OHM 0.1% 1/10W 0603; Manufacturer: Yageo; Resistance: 100kR; Temperature Coefficient: 25ppm/°C; Voltage Rating (DC): 75V; Power Rating: 100mW; Item Type: Resistor; Supplier 1: Digi-Key; Manufacturer Part Number: RT0603BRD07100KL; Stock 1: 53395; Pricing 1: 1=0.39, 10=0.332, 100=0.1298, 1000=0.05435, 2500=0.04982 (USD); Mount: Surface Mount; Case/Package: 0603; Case Code (Imperial): 0603; Case Code (Metric): 1608; Min Operating Temperature: -55°C; Max Operating Temperature: 125°C; Tolerance: 0.1%; Composition: Thin Film; Packaging: Tape and Reel; Voltage Rating: 75V; Package Quantity: 5000; Termination: SMD/SMT; Number of Terminations: 2; Military Standard: Not; Max Power Dissipation: 100mW; Working Voltage: 75V; Features: Moisture Resistant; Length: 1.6mm; Height: 0.022inch; Width: 0.031inch; Depth: 0.8mm; Lead Free: Lead Free; ComponentLink1URL: http://documents.rs-components.com/techlib://itc_doclist_GB.htm?stockno=6174810&src-supplier=RSComponents; ComponentLink1Description: http://documents.rs-components.com/techlib://itc_doclist_GB.htm?stockno=6174810&src-supplier=RSComponents; Supplier Part Number 1: YAG1235CT-ND; LCSC Part Number: C122538
R172 = RT0603BRB07120RL: RES SMD 120 OHM 0.1% 1/10W 0603; Manufacturer: Yageo; Max Power Dissipation: 100mW; Temperature Coefficient: 10ppm/°C; Voltage Rating: 75V; Item Type: Resistor; Supplier: Digikey; Supplier Part Number: RT0603BRB07120RL-ND; Manufacturer Part Number: RT0603BRB07120RL; RoHS: Yes; Category: Chip SMD Resistors; Pricing: 5000=0.13797 (USD); Case/Package: 0603; Min Operating Temperature: -55°C; Max Operating Temperature: 155°C; Packaging: Tape and Reel; Value: 120R; Number of Terminations: 2; Tolerance: 0.1%; Features: Moisture Resistant; Series: RT; Length: 0.063inch; Width: 0.031inch; Height: 0.022inch; RoHS Compliant: Yes; ComponentLink1URL: http://www.yageo.com/documents/recent/PYu-RT_1-to-0.01_RoHS_L_8.pdf?src-supplier=Digikey; ComponentLink1Description: http://www.yageo.com/documents/recent/PYu-RT_1-to-0.01_RoHS_L_8.pdf?src-supplier=Digikey; LCSC Part Number: C860088
R176 R177 = RC0402FR-074K7L: as R16 on sheet Controller_Section; Supplier 1: Avnet; Manufacturer Part Number: RC0402FR-074K7L; RoHS: Yes; Category: Chip SMD Resistors; Stock 1: 2420000; Pricing 1: 10000=0.00085 (USD); Case/Package: 0402; Number of Pins: 2; Case Code (Imperial): 0402; Case Code (Metric): 1005; Size Code: 0402; Min Operating Temperature: -55°C; Max Operating Temperature: 155°C; Tolerance: 1%; Voltage Rating: 50V; Packaging: Tape and Reel; Resistor Type: Thick Film; Termination: SMD/SMT; Features: Moisture Resistant; Series: RC; Number of Terminations: 2; Resistance Tolerance: 1%; Construction: Rectangular; Length: 1mm; Width: 0.5mm; Height: 0.32mm; Depth: 0.5mm; Height - Seated (Max): 0.016inch; RoHS Compliant: Yes; Reach SVHC Compliant: Yes; Military Standard: Not; Lead Free: Lead Free; ComponentLink1URL: https://datasheet.ciiva.com/22661/1686128-22661342.pdf?src-supplier=Element14; ComponentLink1Description: https://datasheet.ciiva.com/22661/1686128-22661342.pdf?src-supplier=Element14; ComponentLink2URL: https://datasheet.ciiva.com/7850/1018594-7850022.pdf?src-supplier=Element14; ComponentLink2Description: https://datasheet.ciiva.com/7850/1018594-7850022.pdf?src-supplier=Element14; ComponentLink3URL: https://datasheet.ciiva.com/7850/1018594-7850023.pdf?src-supplier=Element14; ComponentLink3Description: https://datasheet.ciiva.com/7850/1018594-7850023.pdf?src-supplier=Element14; ComponentLink4URL: https://datasheet.ciiva.com/15215/getdatasheetpartid-328119-15215035.pdf?src-supplier=Verical; ComponentLink4Description: https://datasheet.ciiva.com/15215/getdatasheetpartid-328119-15215035.pdf?src-supplier=Verical; Supplier Part Number 1: RC0402FR-074K7L; LCSC Part Number: C105871
R214 = AT0402BRD0751KL: RES 51K OHM 0.1% 1/16W 0402; Manufacturer: Yageo; Item Type: Resistor; Supplier: Digikey; Supplier Part Number: 13-AT0402BRD0751KLTR-ND; Manufacturer Part Number: AT0402BRD0751KL; RoHS: Yes; Pricing: 10000=0.08359 (USD); LCSC Part Number: C5455493
R215 = RC0402FR-072K7L: RES 2.7K OHM 1% 1/16W 0402; Item Type: Resistor; Value: 2.7kR; Power Rating: 62.5mW; Voltage Rating: 50V; Temperature Coefficient: 100ppm/°C; Max Power Dissipation: 63mW; LCSC Part Number: C138017; ComponentLink1Description: LCSC; Supplier: Future Electronics; Supplier Part Number: 3672441; RoHS: Yes; Category: Chip SMD Resistors; Stock: 490000; Pricing: 10000=0.0009, 50000=0.0008, 300000=0.0008, 1000000=0.0007, 3000000=0.0007 (USD); Case/Package: 0402; Case Code (Imperial): 0402; Case Code (Metric): 1005; Min Operating Temperature: -55°C; Max Operating Temperature: 155°C; Tolerance: 1%; Packaging: Tape and Reel; Package Quantity: 1; Termination: SMD/SMT; Resistor Type: Thick Film; Number of Terminations: 2; Features: Moisture Resistant; Series: RC; Construction: Rectangular; Resistance Tolerance: 1%; Voltage Rating (AC): 50V; Length: 0.039inch; Width: 0.02inch; Height: 0.016inch; Depth: 0.5mm; Military Standard: Not; Lead Free: Lead Free; RoHS Compliant: Yes; Reach SVHC Compliant: Unknown; ComponentLink2URL: https://datasheet.ciiva.com/2519/pyu-r-int-thick-7-2519163.pdf?src-supplier=Digi-Key; ComponentLink2Description: https://datasheet.ciiva.com/2519/pyu-r-int-thick-7-2519163.pdf?src-supplier=Digi-Key; ComponentLink3URL: https://datasheet.ciiva.com/2519/pyu-r-int-thick-7-2519164.pdf?src-supplier=Digi-Key; ComponentLink3Description: https://datasheet.ciiva.com/2519/pyu-r-int-thick-7-2519164.pdf?src-supplier=Digi-Key; ComponentLink4URL: https://datasheet.ciiva.com/2519/pyu-r-int-thick-7-2519162.pdf?src-supplier=Digi-Key; ComponentLink4Description: https://datasheet.ciiva.com/2519/pyu-r-int-thick-7-2519162.pdf?src-supplier=Digi-Key; ComponentLink5URL: https://datasheet.ciiva.com/12656/pyu-rc0402-51-rohs-l-6-r-12656777.pdf?src-supplier=Mouser; ComponentLink5Description: https://datasheet.ciiva.com/12656/pyu-rc0402-51-rohs-l-6-r-12656777.pdf?src-supplier=Mouser; ComponentLink6URL: https://datasheet.ciiva.com/7849/1018594-7849932.pdf?src-supplier=Element14; ComponentLink6Description: https://datasheet.ciiva.com/7849/1018594-7849932.pdf?src-supplier=Element14; ComponentLink7URL: https://datasheet.ciiva.com/7849/1018594-7849933.pdf?src-supplier=Element14; ComponentLink7Description: https://datasheet.ciiva.com/7849/1018594-7849933.pdf?src-supplier=Element14
U15 U16 = UCC27517DBVR: IC GATE DRVR LOW-SIDE SOT23-5; Manufacturer: Texas Instruments; Operating Supply Voltage: 12V; Number of Outputs: 1; Max Supply Voltage: 18V; Min Supply Voltage: 4.5V; Rise Time: 22ns; Propagation Delay: 30ns; Output Current: 4A; Channel Type: Single; Fall Time: 11ns; Supplier: Mouser; LCSC Part Number: C99395; Manufacturer Part Number: UCC27517DBVR; RoHS: Yes; Item Type: IC; Stock: 71094; Pricing: 1=0.77, 10=0.646, 50=0.646, 100=0.501, 1000=0.346, 10000=0.29 (USD); Mounting Technology: Surface Mount; Case/Package: SOT-23-5; Pins: 5; Min Operating Temperature: -40°C; Max Operating Temperature: 140°C; Packaging: Tape and Reel; Package Quantity: 3000; Max Output current: 4A; Number of Drivers: 1; Turn-On Delay Time: 30ns; Number of Channels: 1; Series: -; Length: 2.9mm; Width: 1.6mm; Height: 1.45mm; Thickness: 1.2mm; Radiation Hardening: No; Lead Free: Lead Free; RoHS Compliant: Yes; ComponentLink1URL: http://components.arrow.com/part/dataview/52526194S5756N7713?src-supplier=Arrow+Electronics; ComponentLink1Description: http://components.arrow.com/part/dataview/52526194S5756N7713?src-supplier=Arrow+Electronics; ComponentLink2URL: http://www.ti.com/lit/ds/symlink/ucc27517.pdf?src-supplier=Avnet; ComponentLink2Description: http://www.ti.com/lit/ds/symlink/ucc27517.pdf?src-supplier=Avnet; ComponentLink3URL: http://www.ti.com/lit/ds/symlink/ucc27517.pdf?src-supplier=Digikey; ComponentLink3Description: http://www.ti.com/lit/ds/symlink/ucc27517.pdf?src-supplier=Digikey; ComponentLink4URL: http://www.ti.com/lit/gpn/ucc27517?src-supplier=Mouser; ComponentLink4Description: http://www.ti.com/lit/gpn/ucc27517?src-supplier=Mouser; ComponentLink5URL: http://www.ti.com/general/docs/lit/getliterature.tsp?genericPartNumber=UCC27516&&fileType=pdf&src-supplier=Avnet; ComponentLink5Description: http://www.ti.com/general/docs/lit/getliterature.tsp?genericPartNumber=UCC27516&&fileType=pdf&src-supplier=Avnet; ComponentLink6URL: https://www.verical.com/server-webapp/html/getDatasheet?partID=482756&src-supplier=Verical; ComponentLink6Description: https://www.verical.com/server-webapp/html/getDatasheet?partID=482756&src-supplier=Verical
U31 = TP5591-TR: SOT-23-5 Precision OpAmps ROHS; Manufacturer: 3PEAK; Item Type: OpAmp; Manufacturer Part Number: TP5591-TR; Package: SOT-23-5; LCSC Part Number: C248602; ComponentLink1Description: LCSC; ComponentLink1URL: https://www.lcsc.com/product-detail/Precision-OpAmps_3PEAK-TP5591-TR_C248602.html
U37 = GP8211S-TC50-EW: ESOP-8 Digital to Analog Converters (DAC) ROHS; Manufacturer: Guestgood; Item Type: IC; Manufacturer Part Number: GP8211S-TC50-EW; Package: ESOP-8; LCSC Part Number: C3152008; ComponentLink1Description: LCSC; ComponentLink1URL: https://www.lcsc.com/product-detail/Digital-to-Analog-Converters-DAC_Guestgood-GP8211S-TC50-EW_C3152008.html?s_z=n_gp8211S
U38 = MT3608: boost converterType 1 Boost 28V 2V~24V 1.2MHz SOT-23-6 DC-DC Converters ROHS; Manufacturer: XI'AN Aerosemi Tech; Item Type: IC; Manufacturer Part Number: MT3608; Package: SOT-23-6; LCSC Part Number: C84817; ComponentLink1Description: LCSC; ComponentLink1URL: https://www.lcsc.com/product-detail/DC-DC-Converters_XI-AN-Aerosemi-Tech-MT3608_C84817.html